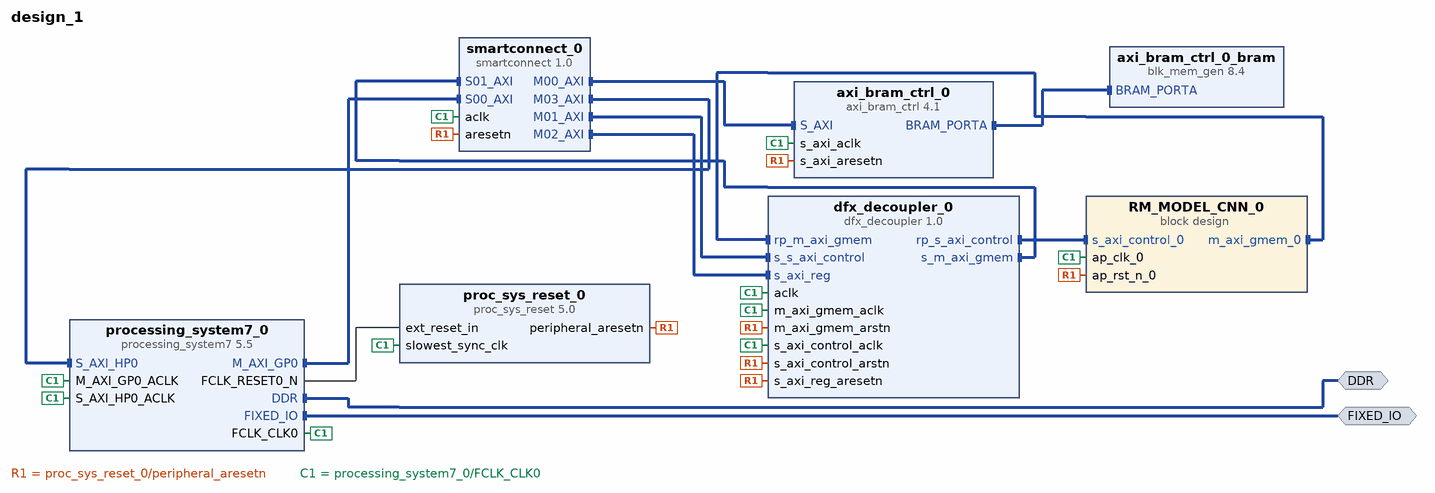
[diagram p0: block diagram of the top level]
# Vivado block design design_1, xc7z020clg400-1, Vivado 2026.1
create_bd_design design_1

create_bd_intf_port -mode Master -vlnv xilinx.com:interface:ddrx_rtl:1.0 DDR
create_bd_intf_port -mode Master -vlnv xilinx.com:display_processing_system7:fixedio_rtl:1.0 FIXED_IO

create_bd_cell -type ip -vlnv xilinx.com:ip:processing_system7:5.5 processing_system7_0
set_property -dict [list \
  CONFIG.PCW_APU_PERIPHERAL_FREQMHZ 650 \
  CONFIG.PCW_CRYSTAL_PERIPHERAL_FREQMHZ 50 \
  CONFIG.PCW_ENET0_ENET0_IO {MIO 16 .. 27} \
  CONFIG.PCW_ENET0_GRP_MDIO_ENABLE 1 \
  CONFIG.PCW_ENET0_GRP_MDIO_IO {MIO 52 .. 53} \
  CONFIG.PCW_ENET0_PERIPHERAL_ENABLE 1 \
  CONFIG.PCW_ENET0_RESET_ENABLE 1 \
  CONFIG.PCW_ENET0_RESET_IO {MIO 9} \
  CONFIG.PCW_ENET_RESET_ENABLE 1 \
  CONFIG.PCW_ENET_RESET_SELECT {Share reset pin} \
  CONFIG.PCW_FPGA0_PERIPHERAL_FREQMHZ 100 \
  CONFIG.PCW_FPGA1_PERIPHERAL_FREQMHZ 50 \
  CONFIG.PCW_GPIO_MIO_GPIO_ENABLE 1 \
  CONFIG.PCW_GPIO_MIO_GPIO_IO MIO \
  CONFIG.PCW_I2C_RESET_ENABLE 1 \
  CONFIG.PCW_M_AXI_GP0_FREQMHZ 10 \
  CONFIG.PCW_PERIPHERAL_BOARD_PRESET part0 \
  CONFIG.PCW_PRESET_BANK1_VOLTAGE {LVCMOS 1.8V} \
  CONFIG.PCW_QSPI_GRP_FBCLK_ENABLE 1 \
  CONFIG.PCW_QSPI_GRP_FBCLK_IO {MIO 8} \
  CONFIG.PCW_QSPI_GRP_SINGLE_SS_ENABLE 1 \
  CONFIG.PCW_QSPI_GRP_SINGLE_SS_IO {MIO 1 .. 6} \
  CONFIG.PCW_QSPI_PERIPHERAL_ENABLE 1 \
  CONFIG.PCW_QSPI_QSPI_IO {MIO 1 .. 6} \
  CONFIG.PCW_SD0_GRP_CD_ENABLE 1 \
  CONFIG.PCW_SD0_GRP_CD_IO {MIO 47} \
  CONFIG.PCW_SD0_GRP_WP_ENABLE 0 \
  CONFIG.PCW_SD0_PERIPHERAL_ENABLE 1 \
  CONFIG.PCW_SD0_SD0_IO {MIO 40 .. 45} \
  CONFIG.PCW_SDIO_PERIPHERAL_FREQMHZ 50 \
  CONFIG.PCW_SINGLE_QSPI_DATA_MODE x4 \
  CONFIG.PCW_UART0_PERIPHERAL_ENABLE 1 \
  CONFIG.PCW_UART0_UART0_IO {MIO 14 .. 15} \
  CONFIG.PCW_UART1_PERIPHERAL_ENABLE 0 \
  CONFIG.PCW_UART_PERIPHERAL_FREQMHZ 100 \
  CONFIG.PCW_UIPARAM_DDR_BUS_WIDTH {16 Bit} \
  CONFIG.PCW_UIPARAM_DDR_FREQ_MHZ 525 \
  CONFIG.PCW_UIPARAM_DDR_PARTNO {MT41J256M16 RE-125} \
  CONFIG.PCW_USB0_PERIPHERAL_ENABLE 1 \
  CONFIG.PCW_USB0_RESET_ENABLE 1 \
  CONFIG.PCW_USB0_RESET_IO {MIO 46} \
  CONFIG.PCW_USB0_USB0_IO {MIO 28 .. 39} \
  CONFIG.PCW_USB_RESET_ENABLE 1 \
  CONFIG.PCW_USB_RESET_SELECT {Share reset pin} \
  CONFIG.PCW_USE_S_AXI_HP0 1 \
] [get_bd_cells processing_system7_0]
# 480 more settings of processing_system7_0 are not shown: defaults, MIO pin electricals, DDR timing, and values the tool derives
create_bd_cell -type ip -vlnv xilinx.com:ip:proc_sys_reset:5.0 proc_sys_reset_0
create_bd_cell -type ip -vlnv xilinx.com:ip:smartconnect:1.0 smartconnect_0
set_property -dict {CONFIG.NUM_MI 4} [get_bd_cells smartconnect_0]
create_bd_cell -type ip -vlnv xilinx.com:ip:axi_bram_ctrl:4.1 axi_bram_ctrl_0
set_property -dict {CONFIG.SINGLE_PORT_BRAM 1} [get_bd_cells axi_bram_ctrl_0]
create_bd_cell -type ip -vlnv xilinx.com:ip:blk_mem_gen:8.4 axi_bram_ctrl_0_bram
create_bd_cell -type container -reference RM_MODEL_CNN RM_MODEL_CNN_0
set_property -dict [list \
  CONFIG.ACTIVE_SIM_BD RM_MODEL_CNN.bd \
  CONFIG.ACTIVE_SYNTH_BD RM_MODEL_CNN.bd \
  CONFIG.ENABLE_DFX true \
  CONFIG.LIST_SIM_BD RM_MODEL_CNN.bd:RM_MODEL_SNN.bd \
  CONFIG.LIST_SYNTH_BD RM_MODEL_CNN.bd:RM_MODEL_SNN.bd \
  CONFIG.LOCK_PROPAGATE 0 \
] [get_bd_cells RM_MODEL_CNN_0]
create_bd_cell -type ip -vlnv xilinx.com:ip:dfx_decoupler:1.0 dfx_decoupler_0
set_property -dict [list \
  CONFIG.ALL_PARAMS {['ALWAYS_HAVE_AXI_CLK 1', 'INTF {', 's_axi_control {ID 0 VLNV xilinx.com:interface:aximm_rtl:1.0 PROTOCOL AXI4LITE SIGNALS {ARVALID {PRESENT 1 WIDTH 1} ARREADY {PRESENT 1 WIDTH 1} AWVALID {PRESENT 1 WIDTH 1} AWREADY {PRESENT 1 WIDTH 1}', 'BVALID {PRESENT 1 WIDTH 1} BREADY {PRESENT 1 WIDTH 1} RVALID {PRESENT 1 WIDTH 1} RREADY {PRESENT 1 WIDTH 1} WVALID {PRESENT 1 WIDTH 1} WREADY {PRESENT 1 WIDTH 1} AWADDR {PRESENT 1 WIDTH 32} AWLEN', '{PRESENT 0 WIDTH 8} AWSIZE {PRESENT 0 WIDTH 3} AWBURST {PRESENT 0 WIDTH 2} AWLOCK {PRESENT 0 WIDTH 1} AWCACHE {PRESENT 0 WIDTH 4} AWPROT {PRESENT 1 WIDTH 3} WDATA {PRESENT 1 WIDTH 32} WSTRB {PRESENT 1', 'WIDTH 4} WLAST {PRESENT 0 WIDTH 1} BRESP {PRESENT 1 WIDTH 2} ARADDR {PRESENT 1 WIDTH 32} ARLEN {PRESENT 0 WIDTH 8} ARSIZE {PRESENT 0 WIDTH 3} ARBURST {PRESENT 0 WIDTH 2} ARLOCK {PRESENT 0 WIDTH 1}', 'ARCACHE {PRESENT 0 WIDTH 4} ARPROT {PRESENT 1 WIDTH 3} RDATA {PRESENT 1 WIDTH 32} RRESP {PRESENT 1 WIDTH 2} RLAST {PRESENT 0 WIDTH 1} AWID {WIDTH 0 PRESENT 0} AWREGION {WIDTH 4 PRESENT 0} AWQOS {WIDTH', '4 PRESENT 0} AWUSER {WIDTH 0 PRESENT 0} WID {WIDTH 0 PRESENT 0} WUSER {WIDTH 0 PRESENT 0} BID {WIDTH 0 PRESENT 0} BUSER {WIDTH 0 PRESENT 0} ARID {WIDTH 0 PRESENT 0} ARREGION {WIDTH 4 PRESENT 0} ARQOS', '{WIDTH 4 PRESENT 0} ARUSER {WIDTH 0 PRESENT 0} RID {WIDTH 0 PRESENT 0} RUSER {WIDTH 0 PRESENT 0}} MODE slave} m_axi_gmem {ID 1 VLNV xilinx.com:interface:aximm_rtl:1.0 PROTOCOL AXI4 SIGNALS {ARVALID', '{WIDTH 1 PRESENT 1} ARREADY {WIDTH 1 PRESENT 1} AWVALID {WIDTH 0 PRESENT 0} AWREADY {WIDTH 0 PRESENT 0} BVALID {WIDTH 0 PRESENT 0} BREADY {WIDTH 0 PRESENT 0} RVALID {WIDTH 1 PRESENT 1} RREADY {WIDTH 1', 'PRESENT 1} WVALID {WIDTH 0 PRESENT 0} WREADY {WIDTH 0 PRESENT 0} AWID {WIDTH 0 PRESENT 0} AWADDR {WIDTH 0 PRESENT 0} AWLEN {WIDTH 0 PRESENT 0} AWSIZE {WIDTH 0 PRESENT 0} AWBURST {WIDTH 0 PRESENT 0}', 'AWLOCK {WIDTH 0 PRESENT 0} AWCACHE {WIDTH 0 PRESENT 0} AWPROT {WIDTH 0 PRESENT 0} AWREGION {WIDTH 0 PRESENT 0} AWQOS {WIDTH 0 PRESENT 0} AWUSER {WIDTH 0 PRESENT 0} WID {WIDTH 0 PRESENT 0} WDATA {WIDTH', '0 PRESENT 0} WSTRB {WIDTH 0 PRESENT 0} WLAST {WIDTH 0 PRESENT 0} WUSER {WIDTH 0 PRESENT 0} BID {WIDTH 0 PRESENT 0} BRESP {WIDTH 0 PRESENT 0} BUSER {WIDTH 0 PRESENT 0} ARID {WIDTH 1 PRESENT 1} ARADDR', '{WIDTH 64 PRESENT 1} ARLEN {WIDTH 8 PRESENT 1} ARSIZE {WIDTH 3 PRESENT 1} ARBURST {WIDTH 2 PRESENT 0} ARLOCK {WIDTH 1 PRESENT 1} ARCACHE {WIDTH 4 PRESENT 1} ARPROT {WIDTH 3 PRESENT 1} ARREGION {WIDTH', '4 PRESENT 1} ARQOS {WIDTH 4 PRESENT 1} ARUSER {WIDTH 0 PRESENT 0} RID {WIDTH 1 PRESENT 1} RDATA {WIDTH 32 PRESENT 1} RRESP {WIDTH 2 PRESENT 1} RLAST {WIDTH 1 PRESENT 1} RUSER {WIDTH 0 PRESENT 0}}}', '}', 'HAS_SIGNAL_STATUS 1', 'HAS_SIGNAL_CONTROL 0', 'HAS_AXI_LITE 1']} \
  CONFIG.GUI_INTERFACE_NAME s_axi_control \
  CONFIG.GUI_SELECT_VLNV xilinx.com:interface:aximm_rtl:1.0 \
] [get_bd_cells dfx_decoupler_0]

# ---- connections ----

connect_bd_intf_net [get_bd_intf_pins RM_MODEL_CNN_0/m_axi_gmem_0] [get_bd_intf_pins dfx_decoupler_0/rp_m_axi_gmem]
connect_bd_intf_net [get_bd_intf_pins axi_bram_ctrl_0_bram/BRAM_PORTA] [get_bd_intf_pins axi_bram_ctrl_0/BRAM_PORTA]
connect_bd_intf_net [get_bd_intf_pins dfx_decoupler_0/rp_s_axi_control] [get_bd_intf_pins RM_MODEL_CNN_0/s_axi_control_0]
connect_bd_intf_net [get_bd_intf_pins dfx_decoupler_0/s_m_axi_gmem] [get_bd_intf_pins smartconnect_0/S01_AXI]
connect_bd_intf_net [get_bd_intf_ports DDR] [get_bd_intf_pins processing_system7_0/DDR]
connect_bd_intf_net [get_bd_intf_ports FIXED_IO] [get_bd_intf_pins processing_system7_0/FIXED_IO]
connect_bd_intf_net [get_bd_intf_pins processing_system7_0/M_AXI_GP0] [get_bd_intf_pins smartconnect_0/S00_AXI]
connect_bd_intf_net [get_bd_intf_pins smartconnect_0/M00_AXI] [get_bd_intf_pins axi_bram_ctrl_0/S_AXI]
connect_bd_intf_net [get_bd_intf_pins smartconnect_0/M01_AXI] [get_bd_intf_pins dfx_decoupler_0/s_s_axi_control]
connect_bd_intf_net [get_bd_intf_pins smartconnect_0/M02_AXI] [get_bd_intf_pins dfx_decoupler_0/s_axi_reg]
connect_bd_intf_net [get_bd_intf_pins processing_system7_0/S_AXI_HP0] [get_bd_intf_pins smartconnect_0/M03_AXI]
connect_bd_net [get_bd_pins proc_sys_reset_0/peripheral_aresetn] \
  [get_bd_pins smartconnect_0/aresetn] [get_bd_pins axi_bram_ctrl_0/s_axi_aresetn] [get_bd_pins RM_MODEL_CNN_0/ap_rst_n_0] \
  [get_bd_pins dfx_decoupler_0/s_axi_control_arstn] [get_bd_pins dfx_decoupler_0/m_axi_gmem_arstn] \
  [get_bd_pins dfx_decoupler_0/s_axi_reg_aresetn]
connect_bd_net [get_bd_pins processing_system7_0/FCLK_CLK0] \
  [get_bd_pins proc_sys_reset_0/slowest_sync_clk] [get_bd_pins processing_system7_0/M_AXI_GP0_ACLK] \
  [get_bd_pins smartconnect_0/aclk] [get_bd_pins axi_bram_ctrl_0/s_axi_aclk] [get_bd_pins RM_MODEL_CNN_0/ap_clk_0] \
  [get_bd_pins dfx_decoupler_0/s_axi_control_aclk] [get_bd_pins dfx_decoupler_0/m_axi_gmem_aclk] \
  [get_bd_pins dfx_decoupler_0/aclk] [get_bd_pins processing_system7_0/S_AXI_HP0_ACLK]
connect_bd_net [get_bd_pins processing_system7_0/FCLK_RESET0_N] [get_bd_pins proc_sys_reset_0/ext_reset_in]
set_property HDL_ATTRIBUTE.BMM_INFO_PROCESSOR {arm > design_1 axi_bram_ctrl_0} [get_bd_cells processing_system7_0]
set_property HDL_ATTRIBUTE.KEEP_HIERARCHY yes [get_bd_cells processing_system7_0]
set_property HDL_ATTRIBUTE.BMM_INFO_ADDRESS_SPACE {byte  0x40000000 32 > design_1 axi_bram_ctrl_0_bram} [get_bd_cells axi_bram_ctrl_0]
set_property HDL_ATTRIBUTE.KEEP_HIERARCHY yes [get_bd_cells axi_bram_ctrl_0]

# ---- address map ----
assign_bd_address -offset 0x40000000 -range 16K -target_address_space [get_bd_addr_spaces processing_system7_0/Data] [get_bd_addr_segs axi_bram_ctrl_0/S_AXI/Mem0]
assign_bd_address -offset 0x43C00000 -range 64K -target_address_space [get_bd_addr_spaces processing_system7_0/Data] [get_bd_addr_segs dfx_decoupler_0/s_axi_reg/Reg]
assign_bd_address -offset 0x43C10000 -range 64K -target_address_space [get_bd_addr_spaces processing_system7_0/Data] [get_bd_addr_segs RM_MODEL_CNN_0/ds_cnn_0/s_axi_control/Reg]
exclude_bd_addr_seg -offset 0x00000000 -range 1 -target_address_space [get_bd_addr_spaces processing_system7_0/Data] [get_bd_addr_segs processing_system7_0/S_AXI_HP0/HP0_DDR_LOWOCM]
assign_bd_address -offset 0x0000000000000000 -range 512M -target_address_space [get_bd_addr_spaces RM_MODEL_CNN_0/ds_cnn_0/Data_m_axi_gmem] [get_bd_addr_segs processing_system7_0/S_AXI_HP0/HP0_DDR_LOWOCM]
assign_bd_address -offset 0x0000000040000000 -range 16K -target_address_space [get_bd_addr_spaces RM_MODEL_CNN_0/ds_cnn_0/Data_m_axi_gmem] [get_bd_addr_segs axi_bram_ctrl_0/S_AXI/Mem0]
exclude_bd_addr_seg -offset 0x0000000000000000 -range 1 -target_address_space [get_bd_addr_spaces RM_MODEL_CNN_0/ds_cnn_0/Data_m_axi_gmem] [get_bd_addr_segs dfx_decoupler_0/s_axi_reg/Reg]
exclude_bd_addr_seg -offset 0x0000000000000000 -range 1 -target_address_space [get_bd_addr_spaces RM_MODEL_CNN_0/ds_cnn_0/Data_m_axi_gmem] [get_bd_addr_segs RM_MODEL_CNN_0/ds_cnn_0/s_axi_control/Reg]

validate_bd_design
save_bd_design
